# Altium project PGS-System.PrjPcb (part 8 of 16)

## Sheet RV1126_DRAM_SHEET.SchDoc
size A4; SheetNumber: 10; SheetTotal: 25
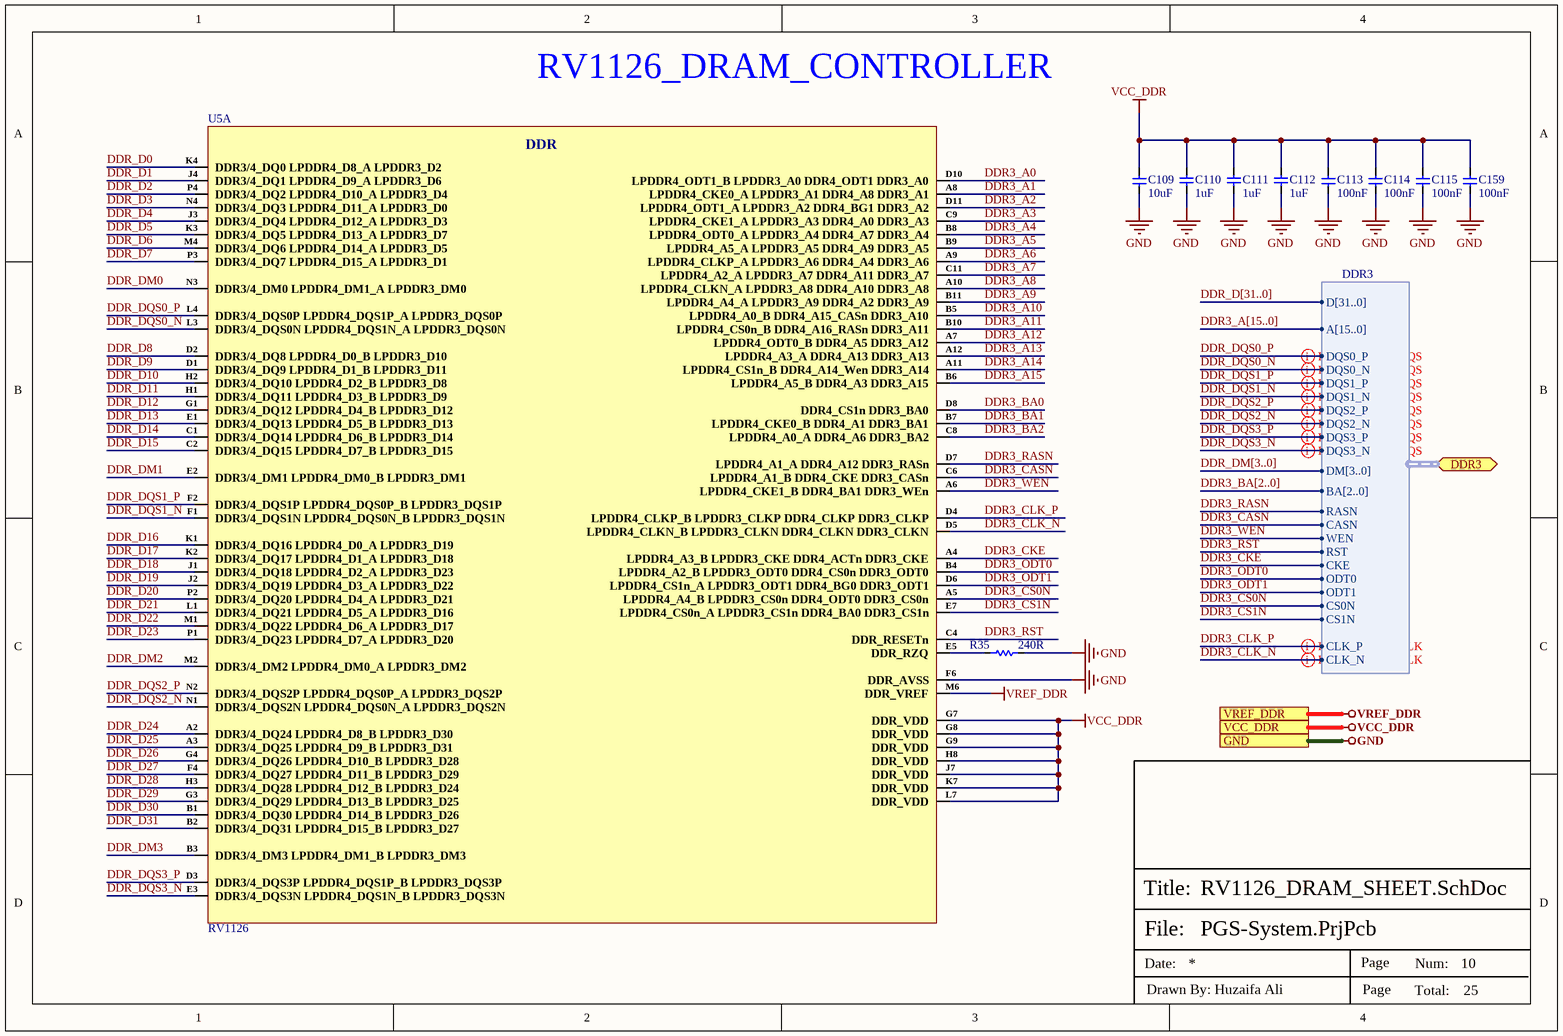
[diagram p10: RV1126_DRAM_SHEET.SchDoc]

### Parts
C109  10uF  [Cap-0603]
C110  1uF  [Cap-0402]
C111  1uF  [Cap-0402]
C112  1uF  [Cap-0402]
C113  100nF  [CAP-0201]
C114  100nF  [CAP-0201]
C115  100nF  [CAP-0201]
C159  100nF  [CAP-0201]
R35  240R  [Res-0201]
U5  RV1126  [FCCSP-409(14x14)]  (part A of 15)

### Ports
DDR3 (bidir, harness DDR3, see DDR3_SDRAM_INTERFACE[4C]), GND (see DDR3_SDRAM_INTERFACE[4D], DIGITAL_MEMS_MIC_INTERFACE[3D], eMMC_INTERFACE[3D], ETHERNET_SWITCH_INTERFACE[5C], IR-CUT_LIGHT SENSOR_SHEET[3D], MIPI TO HDMI_MODULE_INTERFACE[3D], MIPI-CSI_RXX_INTERFACE[4C], PoE PD INTERFACE[3D], PoE_PSE_CONTROLLER[5D], POWER_LDO_SHEET[3D], POWER_PMIC_RK809_CODEC[3D], POWER_PMIC_RK809_DC DC[3D], POWER_PMIC_RK809_LDO[4C], POWER_PMIC_RK809_MANAGEMENT[3D], RV1126_AUDIO_SHEET[3D], RV1126_eMMC_SPI-FLASH_SHEET[3D], RV1126_ETHERNET_SHEET[3D], RV1126_OSC-PLL-PMUIO[3C], RV1126_POWER_SHEET[1D], RV1126_SARADC_SHEET[3C], SPI_FLASH_INTERFACE[3D], SYNCHRONOUS _BUCK_CONTROLLER[3D], USB2.0_DEBUG_UART[3D], WIFI_AP6256_SHEET[4D]), VCC_DDR (see DDR3_SDRAM_INTERFACE[4D], POWER_PMIC_RK809_DC DC[3D]), VREF_DDR (see DDR3_SDRAM_INTERFACE[4D])

### Harnesses
DDR3: D[31..0], A[15..0], DQS0_N, DQS0_P, DQS1_N, DQS1_P, BA[2..0], CASN, RST, CKE, CS0N, CLK_P, CLK_N, DQS2_N, DQS2_P, DQS3_N, DQS3_P, CS1N, ODT0, ODT1, WEN, RASN, DM[3..0]

### Nets
GND: C109.1 C110.2 C111.2 C112.2 C113.1 C114.1 C115.1 C159.1 R35.2 U5.F6(DDR_AVSS) ; port GND  [project net KSENSD]
VCC_DDR: C109.2 C110.1 C111.1 C112.1 C113.2 C114.2 C115.2 C159.2 U5.G7(DDR_VDD) U5.G8(DDR_VDD) U5.G9(DDR_VDD) U5.H8(DDR_VDD) U5.J7(DDR_VDD) U5.K7(DDR_VDD) U5.L7(DDR_VDD) ; port VCC_DDR
VREF_DDR: U5.M6(DDR_VREF) ; port VREF_DDR
DDR3_A0: U5.D10(LPDDR4_ODT1_B_LPDDR3_A0_DDR4_ODT1_DDR3_A0)
DDR3_A1: U5.A8(LPDDR4_CKE0_A_LPDDR3_A1_DDR4_A8_DDR3_A1)
DDR3_A2: U5.D11(LPDDR4_ODT1_A_LPDDR3_A2_DDR4_BG1_DDR3_A2)
DDR3_A3: U5.C9(LPDDR4_CKE1_A_LPDDR3_A3_DDR4_A0_DDR3_A3)
DDR3_A4: U5.B8(LPDDR4_ODT0_A_LPDDR3_A4_DDR4_A7_DDR3_A4)
DDR3_A5: U5.B9(LPDDR4_A5_A_LPDDR3_A5_DDR4_A9_DDR3_A5)
DDR3_A6: U5.A9(LPDDR4_CLKP_A_LPDDR3_A6_DDR4_A4_DDR3_A6)
DDR3_A7: U5.C11(LPDDR4_A2_A_LPDDR3_A7_DDR4_A11_DDR3_A7)
DDR3_A8: U5.A10(LPDDR4_CLKN_A_LPDDR3_A8_DDR4_A10_DDR3_A8)
DDR3_A9: U5.B11(LPDDR4_A4_A_LPDDR3_A9_DDR4_A2_DDR3_A9)
DDR3_A10: U5.B5(LPDDR4_A0_B_DDR4_A15_CASn_DDR3_A10)
DDR3_A11: U5.B10(LPDDR4_CS0n_B_DDR4_A16_RASn_DDR3_A11)
DDR3_A12: U5.A7(LPDDR4_ODT0_B_DDR4_A5_DDR3_A12)
DDR3_A13: U5.A12(LPDDR4_A3_A_DDR4_A13_DDR3_A13)
DDR3_A14: U5.A11(LPDDR4_CS1n_B_DDR4_A14_Wen_DDR3_A14)
DDR3_A15: U5.B6(LPDDR4_A5_B_DDR4_A3_DDR3_A15)
DDR3_BA0: U5.D8(DDR4_CS1n_DDR3_BA0)
DDR3_BA1: U5.B7(LPDDR4_CKE0_B_DDR4_A1_DDR3_BA1)
DDR3_BA2: U5.C8(LPDDR4_A0_A_DDR4_A6_DDR3_BA2)
DDR3_CASN: U5.C6(LPDDR4_A1_B_DDR4_CKE_DDR3_CASn) ; port DDR3.CASN
DDR3_CKE: U5.A4(LPDDR4_A3_B_LPDDR3_CKE_DDR4_ACTn_DDR3_CKE) ; port DDR3.CKE
DDR3_CLK_N: U5.D5(LPDDR4_CLKN_B_LPDDR3_CLKN_DDR4_CLKN_DDR3_CLKN) ; port DDR3.CLK_N
DDR3_CLK_P: U5.D4(LPDDR4_CLKP_B_LPDDR3_CLKP_DDR4_CLKP_DDR3_CLKP) ; port DDR3.CLK_P
DDR3_CS0N: U5.A5(LPDDR4_A4_B_LPDDR3_CS0n_DDR4_ODT0_DDR3_CS0n) ; port DDR3.CS0N
DDR3_CS1N: U5.E7(LPDDR4_CS0n_A_LPDDR3_CS1n_DDR4_BA0_DDR3_CS1n) ; port DDR3.CS1N
DDR3_ODT0: U5.B4(LPDDR4_A2_B_LPDDR3_ODT0_DDR4_CS0n_DDR3_ODT0) ; port DDR3.ODT0
DDR3_ODT1: U5.D6(LPDDR4_CS1n_A_LPDDR3_ODT1_DDR4_BG0_DDR3_ODT1) ; port DDR3.ODT1
DDR3_RASN: U5.D7(LPDDR4_A1_A_DDR4_A12_DDR3_RASn) ; port DDR3.RASN
DDR3_RST: U5.C4(DDR_RESETn) ; port DDR3.RST
DDR3_WEN: U5.A6(LPDDR4_CKE1_B_DDR4_BA1_DDR3_WEn) ; port DDR3.WEN
DDR_D0: U5.K4(DDR3/4_DQ0_LPDDR4_D8_A_LPDDR3_D2)
DDR_D1: U5.J4(DDR3/4_DQ1_LPDDR4_D9_A_LPDDR3_D6)
DDR_D2: U5.P4(DDR3/4_DQ2_LPDDR4_D10_A_LPDDR3_D4)
DDR_D3: U5.N4(DDR3/4_DQ3_LPDDR4_D11_A_LPDDR3_D0)
DDR_D4: U5.J3(DDR3/4_DQ4_LPDDR4_D12_A_LPDDR3_D3)
DDR_D5: U5.K3(DDR3/4_DQ5_LPDDR4_D13_A_LPDDR3_D7)
DDR_D6: U5.M4(DDR3/4_DQ6_LPDDR4_D14_A_LPDDR3_D5)
DDR_D7: U5.P3(DDR3/4_DQ7_LPDDR4_D15_A_LPDDR3_D1)
DDR_D8: U5.D2(DDR3/4_DQ8_LPDDR4_D0_B_LPDDR3_D10)
DDR_D9: U5.D1(DDR3/4_DQ9_LPDDR4_D1_B_LPDDR3_D11)
DDR_D10: U5.H2(DDR3/4_DQ10_LPDDR4_D2_B_LPDDR3_D8)
DDR_D11: U5.H1(DDR3/4_DQ11_LPDDR4_D3_B_LPDDR3_D9)
DDR_D12: U5.G1(DDR3/4_DQ12_LPDDR4_D4_B_LPDDR3_D12)
DDR_D13: U5.E1(DDR3/4_DQ13_LPDDR4_D5_B_LPDDR3_D13)
DDR_D14: U5.C1(DDR3/4_DQ14_LPDDR4_D6_B_LPDDR3_D14)
DDR_D15: U5.C2(DDR3/4_DQ15_LPDDR4_D7_B_LPDDR3_D15)
DDR_D16: U5.K1(DDR3/4_DQ16_LPDDR4_D0_A_LPDDR3_D19)
DDR_D17: U5.K2(DDR3/4_DQ17_LPDDR4_D1_A_LPDDR3_D18)
DDR_D18: U5.J1(DDR3/4_DQ18_LPDDR4_D2_A_LPDDR3_D23)
DDR_D19: U5.J2(DDR3/4_DQ19_LPDDR4_D3_A_LPDDR3_D22)
DDR_D20: U5.P2(DDR3/4_DQ20_LPDDR4_D4_A_LPDDR3_D21)
DDR_D21: U5.L1(DDR3/4_DQ21_LPDDR4_D5_A_LPDDR3_D16)
DDR_D22: U5.M1(DDR3/4_DQ22_LPDDR4_D6_A_LPDDR3_D17)
DDR_D23: U5.P1(DDR3/4_DQ23_LPDDR4_D7_A_LPDDR3_D20)
DDR_D24: U5.A2(DDR3/4_DQ24_LPDDR4_D8_B_LPDDR3_D30)
DDR_D25: U5.A3(DDR3/4_DQ25_LPDDR4_D9_B_LPDDR3_D31)
DDR_D26: U5.G4(DDR3/4_DQ26_LPDDR4_D10_B_LPDDR3_D28)
DDR_D27: U5.F4(DDR3/4_DQ27_LPDDR4_D11_B_LPDDR3_D29)
DDR_D28: U5.H3(DDR3/4_DQ28_LPDDR4_D12_B_LPDDR3_D24)
DDR_D29: U5.G3(DDR3/4_DQ29_LPDDR4_D13_B_LPDDR3_D25)
DDR_D30: U5.B1(DDR3/4_DQ30_LPDDR4_D14_B_LPDDR3_D26)
DDR_D31: U5.B2(DDR3/4_DQ31_LPDDR4_D15_B_LPDDR3_D27)
DDR_DM0: U5.N3(DDR3/4_DM0_LPDDR4_DM1_A_LPDDR3_DM0)
DDR_DM1: U5.E2(DDR3/4_DM1_LPDDR4_DM0_B_LPDDR3_DM1)
DDR_DM2: U5.M2(DDR3/4_DM2_LPDDR4_DM0_A_LPDDR3_DM2)
DDR_DM3: U5.B3(DDR3/4_DM3_LPDDR4_DM1_B_LPDDR3_DM3)
DDR_DQS0_N: U5.L3(DDR3/4_DQS0N_LPDDR4_DQS1N_A_LPDDR3_DQS0N) ; port DDR3.DQS0_N
DDR_DQS0_P: U5.L4(DDR3/4_DQS0P_LPDDR4_DQS1P_A_LPDDR3_DQS0P) ; port DDR3.DQS0_P
DDR_DQS1_N: U5.F1(DDR3/4_DQS1N_LPDDR4_DQS0N_B_LPDDR3_DQS1N) ; port DDR3.DQS1_N
DDR_DQS1_P: U5.F2(DDR3/4_DQS1P_LPDDR4_DQS0P_B_LPDDR3_DQS1P) ; port DDR3.DQS1_P
DDR_DQS2_N: U5.N1(DDR3/4_DQS2N_LPDDR4_DQS0N_A_LPDDR3_DQS2N) ; port DDR3.DQS2_N
DDR_DQS2_P: U5.N2(DDR3/4_DQS2P_LPDDR4_DQS0P_A_LPDDR3_DQS2P) ; port DDR3.DQS2_P
DDR_DQS3_N: U5.E3(DDR3/4_DQS3N_LPDDR4_DQS1N_B_LPDDR3_DQS3N) ; port DDR3.DQS3_N
DDR_DQS3_P: U5.D3(DDR3/4_DQS3P_LPDDR4_DQS1P_B_LPDDR3_DQS3P) ; port DDR3.DQS3_P
NetR35_1: R35.1 U5.E5(DDR_RZQ)

### Buses and harness runs
bus DDR3_A[15..0]
bus DDR3_BA[2..0]
bus DDR_D[31..0]
bus DDR_DM[3..0]

### Layout directives
differential pair; differential pair class 100OHM_DDR_DQS: DDR_DQS0_N, DDR_DQS0_P, DDR_DQS1_N, DDR_DQS1_P, DDR_DQS2_N, DDR_DQS2_P, DDR_DQS3_N, DDR_DQS3_P
differential pair; differential pair class 100OHM_DDR_CLK: DDR3_CLK_N, DDR3_CLK_P

### Notes on the sheet
- RV1126_DRAM_CONTROLLER
- File:
- Title:
- Date:
- Page
- Num:
- Total:
- Drawn By: Huzaifa Ali
- (in symbol RV1126, part A) DDR

### Library data of the parts
C109 = CC0603KRX5R6BB106: as C38 on sheet POWER_PMIC_RK809_CODEC; Supplier 1: Digi-Key; Manufacturer Part Number: CC0603KRX5R6BB106; RoHS: Yes; Category: Ceramic Capacitors; Stock 1: 187515; Pricing 1: 1=0.24000, 10=0.16300, 50=0.09780, 100=0.08260, 500=0.05654, 1000=0.05001 (USD); Mount: Surface Mount; Case/Package: 0603; Case Code (Metric): 1608; Case Code (Imperial): 0603; Weight: 7.1E-05oz; Min Operating Temperature: -55°C; Max Operating Temperature: 85°C; Capacitance: 10uF; Packaging: Tape and Reel; Dielectric: X5R; Voltage Rating: 10V; Termination: SMD/SMT; Resistor Type: Ceramic; Voltage Rating (DC): 10V; Package Quantity: 4000; Length: 0.063inch; Width: 0.031inch; Thickness: 0.035inch; Depth: 0.8mm; Lead Free: Lead Free; Halogen Free: Halogen Free; RoHS Compliant: Yes; ComponentLink1URL: http://www.mouser.com/ds/2/447/Yageo_UPY-GP_NP0_16V-to-50V_9-358835.pdf?src-supplier=Mouser; ComponentLink1Description: http://www.mouser.com/ds/2/447/Yageo_UPY-GP_NP0_16V-to-50V_9-358835.pdf?src-supplier=Mouser; ComponentLink2URL: http://www.yageo.com/documents/recent/UPY-GPHC_X5R_4V-to-50V_25.pdf?src-supplier=Digi-Key; ComponentLink2Description: http://www.yageo.com/documents/recent/UPY-GPHC_X5R_4V-to-50V_25.pdf?src-supplier=Digi-Key; Supplier Part Number 1: 311-1782-1-ND; LCSC Part Number: C326057
C110-C112 = CC0402KRX5R6BB105: as C31 on sheet POWER_PMIC_RK809_MGM; Supplier 1: Mouser; Manufacturer Part Number: CC0402KRX5R6BB105; RoHS: Yes; Category: Ceramic Capacitors; Stock 1: 6711367; Pricing 1: 1=0.11000, 10=0.05500, 50=0.05500, 100=0.03300, 500=0.02700, 1000=0.02200, 2500=0.02100, 10000=0.01800 (USD); Mount: Surface Mount; Case/Package: 0402; Number of Pins: 2; Case Code (Metric): 1005; Case Code (Imperial): 0402; Min Operating Temperature: -55°C; Max Operating Temperature: 85°C; Capacitance: 1uF; Dielectric: X5R; Package Quantity: 1; Voltage Rating: 10V; Packaging: Tape and Reel; Voltage Rating (DC): 10V; Termination: SMD/SMT; Resistor Type: Ceramic; Series: CC; Construction: Flat; Length: 1mm; Width: 0.02inch; Height: 0.5mm; Thickness: 0.022inch; Depth: 0.5mm; Radiation Hardening: No; REACH SVHC: No SVHC; Lead Free: Lead Free; Halogen Free: Halogen Free; RoHS Compliant: Yes; ComponentLink1URL: https://datasheet.ciiva.com/176/upy-gphc-x5r-4v-to-50v-12-176704.pdf?src-supplier=Digi-Key; ComponentLink1Description: https://datasheet.ciiva.com/176/upy-gphc-x5r-4v-to-50v-12-176704.pdf?src-supplier=Digi-Key; ComponentLink2URL: https://datasheet.ciiva.com/176/mlccorderingcode-176705.pdf?src-supplier=Digi-Key; ComponentLink2Description: https://datasheet.ciiva.com/176/mlccorderingcode-176705.pdf?src-supplier=Digi-Key; ComponentLink3URL: https://datasheet.ciiva.com/176/mlccorderingcode-176706.pdf?src-supplier=Digi-Key; ComponentLink3Description: https://datasheet.ciiva.com/176/mlccorderingcode-176706.pdf?src-supplier=Digi-Key; Supplier Part Number 1: 603-CC402KRX5R6BB105; LCSC Part Number: C106254
C113-C115 C159 = CC0201KRX5R6BB104: as C88-C91 on sheet RV1126_POWER_SHEET; Supplier 1: Mouser; Manufacturer Part Number: CC0201KRX5R6BB104; RoHS: Yes; Category: Ceramic Capacitors; Stock 1: 824403; Pricing 1: 1=0.10000, 10=0.02400, 50=0.02400, 100=0.01900, 1000=0.01100, 10000=0.00900 (USD); Mount: Surface Mount; Case/Package: 0201; Case Code (Imperial): 0201; Case Code (Metric): 0603; Min Operating Temperature: -55°C; Max Operating Temperature: 85°C; Capacitance: 100nF; Dielectric: X5R; Packaging: Tape and Reel; Voltage Rating: 10V; Termination: SMD/SMT; Voltage Rating (DC): 10V; Series: CC; Length: 0.6mm; Width: 0.012inch; Height: 0.3mm; Depth: 0.3mm; Thickness: 0.013inch; Radiation Hardening: No; RoHS Compliant: Yes; Lead Free: Lead Free; Halogen Free: Halogen Free; ComponentLink1URL: https://datasheet.ciiva.com/11587/upy-gphc-x5r-4v-to-50v-12-11587190.pdf?src-supplier=Avnet; ComponentLink1Description: https://datasheet.ciiva.com/11587/upy-gphc-x5r-4v-to-50v-12-11587190.pdf?src-supplier=Avnet; Supplier Part Number 1: 603-CC201KRX5R6BB104; LCSC Part Number: C190183; Weight: 6E-06oz; Resistor Type: Ceramic; Construction: Flat
R35 = RC0201FR-07240RL: RES 240 OHM 1% 1/20W 0201; Manufacturer: Yageo; Power Rating: 50mW; Temperature Coefficient: 200ppm/°C; Item Type: Resistor; Supplier 1: Avnet; Manufacturer Part Number: RC0201FR-07240RL; RoHS: Yes; Category: Chip SMD Resistors; Stock 1: 90000; Pricing 1: 10000=0.00128 (USD); Mount: Surface Mount; Case/Package: 0201; Case Code (Metric): 0603; Case Code (Imperial): 0201; Min Operating Temperature: -55°C; Max Operating Temperature: 125°C; Resistance: 240R; Tolerance: 1%; Packaging: Tape and Reel; Resistor Type: Thick Film; Number of Terminations: 2; Max Power Dissipation: 50mW; Features: Moisture Resistant; Length: 0.024inch; Width: 0.012inch; Height: 0.01inch; Depth: 0.3mm; Military Standard: Not; Lead Free: Lead Free; RoHS Compliant: Yes; ComponentLink1URL: http://www.yageo.com/documents/recent/PYu-RC0201_51_RoHS_L_(8).pdf?src-supplier=Future+Electronics; ComponentLink1Description: http://www.yageo.com/documents/recent/PYu-RC0201_51_RoHS_L_(8).pdf?src-supplier=Future+Electronics; ComponentLink2URL: http://www.yageo.com/documents/recent/PYu-RC_Group_51_RoHS_L_10.pdf?src-supplier=Digi-Key; ComponentLink2Description: http://www.yageo.com/documents/recent/PYu-RC_Group_51_RoHS_L_10.pdf?src-supplier=Digi-Key; ComponentLink3URL: https://www.yageo.com/upload/media/product/productsearch/datasheet/rchip/PYu-RC_Group_51_RoHS_L_11.pdf?src-supplier=Digi-Key; ComponentLink3Description: https://www.yageo.com/upload/media/product/productsearch/datasheet/rchip/PYu-RC_Group_51_RoHS_L_11.pdf?src-supplier=Digi-Key; ComponentLink4URL: http://www.yageo.com/documents/recent/PYu-RC_Group_51_RoHS_L_9.pdf?src-supplier=Digi-Key; ComponentLink4Description: http://www.yageo.com/documents/recent/PYu-RC_Group_51_RoHS_L_9.pdf?src-supplier=Digi-Key; Supplier Part Number 1: RC0201FR-07240RL; LCSC Part Number: C155745
U5 = RV1126: as U5 on sheet RV1126_POWER_SHEET; Manufacturer Part Number: RV1126; Package: FCCSP-409(14x14); LCSC Part Number: C2859017; Item Type: Microcontroller; ComponentLink1Description: LCSC; ComponentLink1URL: https://www.lcsc.com/product-detail/Microcontroller-Units-MCUs-MPUs-SOCs_Rockchip-RV1126_C2859017.html

## Sheet RV1126_SARADC_SHEET.SchDoc
size A4; SheetNumber: 11; SheetTotal: 27
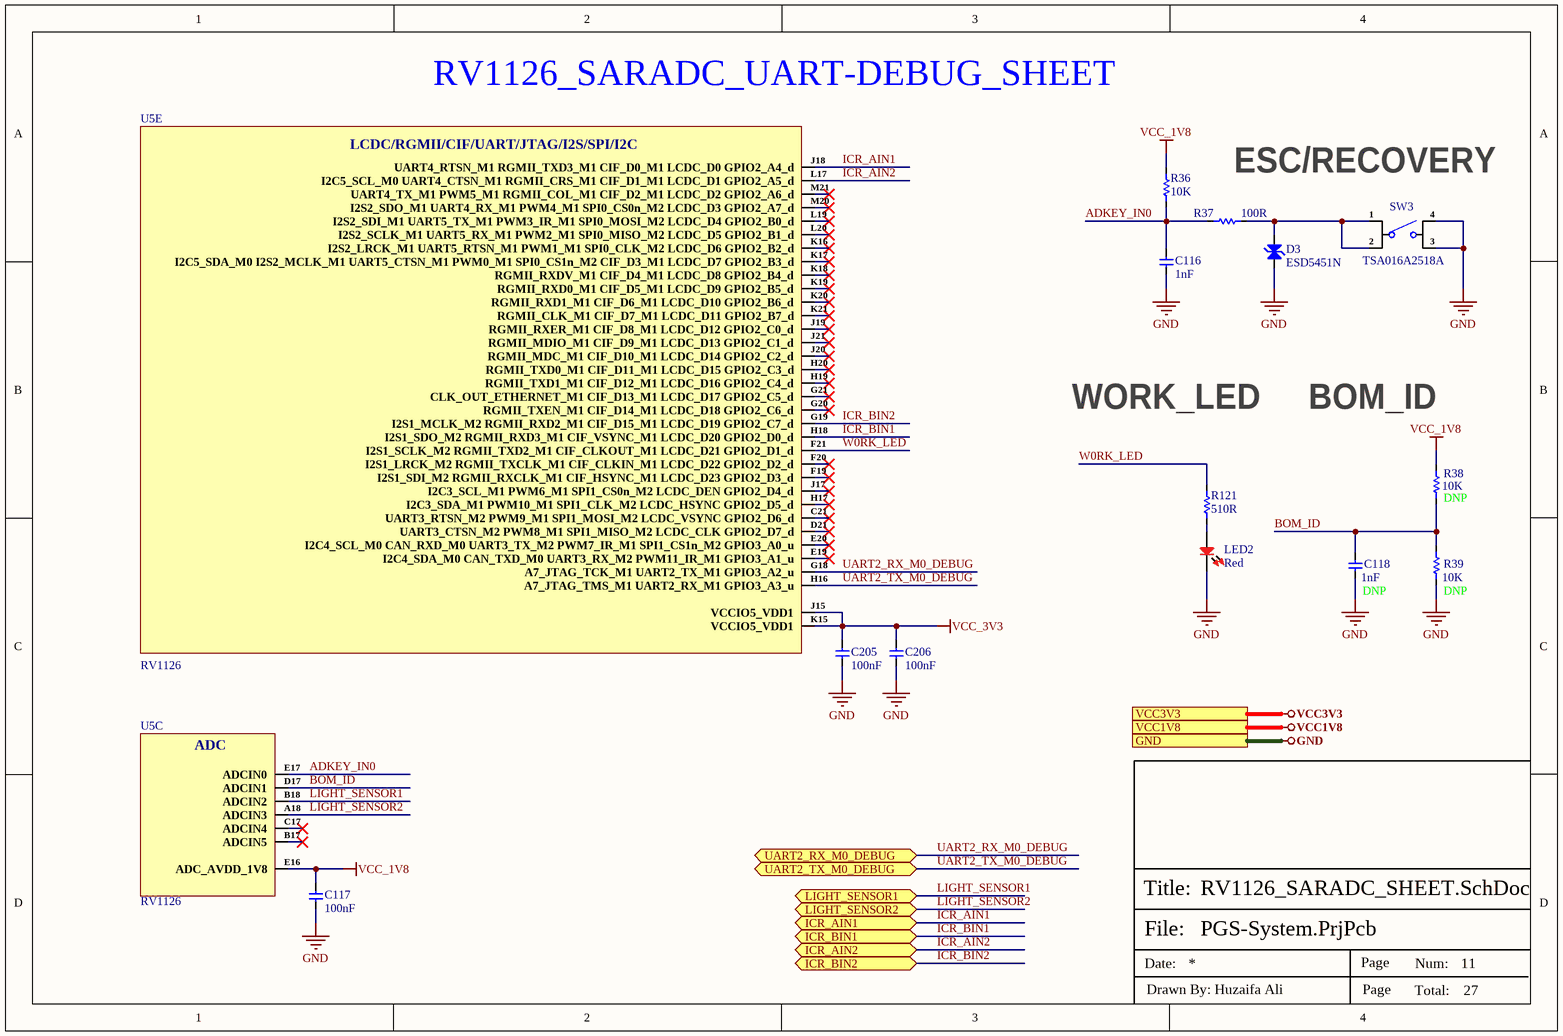
[diagram p11: RV1126_SARADC_SHEET.SchDoc]

### Parts
C116  1nF  [Cap-0402]
C117  100nF  [CAP-0201]
C118  DNP  [Cap-0402]
C205  100nF  [CAP-0201]
C206  100nF  [CAP-0201]
D3  ESD5451N  [DFN1006-2L (Bi-Directional)]
LED2  Red  [LED-0402]
R36  10K  [Res-0402]
R37  100R  [Res-0402]
R38  DNP  [Res-0402]
R39  DNP  [Res-0402]
R121  510R  [Res-0402]
SW3  TSA016A2518A  [TSA016A2518A]
U5  RV1126  [FCCSP-409(14x14)]  (parts C,E of 15)

### Ports
GND (see BUCK_CONTROLLER_SHEET[3D], DDR3_SDRAM_SHEET[5D], DEBUG_UART_INTERFACE[3D], DIGITAL_MEMS_INTERFACE[3C], eMMC_INTERFACE[3D], ETH_PoE-PD_INTERFACE[4D], ETH_SWITCH_INTERFACE[5D], IR-CUT_LIGHT SENSOR_SHEET[3D], MIPI TO HDMI_MODULE[3D], MIPI-CSI_RXX_INTERFACE[3C], PoE_PSE_CONTROLLER[5D], POWER_LDO_SHEET[3D], POWER_PMIC_RK809_CODEC[3C], POWER_PMIC_RK809_DC DC[3D], POWER_PMIC_RK809_LDO[4C], POWER_PMIC_RK809_MGM[3D], RV1126_AUDIO_SHEET[3D], RV1126_DRAM_SHEET[4C], RV1126_eMMC_SPI-FLASH[3C], RV1126_ETHERNET_SHEET[3D], RV1126_OSC-PLL-PMUIO[3C], RV1126_POWER_SHEET[1D], RV1126_SDMMC_SHEET[3C], SPI_FLASH_INTERFACE[3D], USB2.0_DEBUG_UART[3D], WIFI_AP6256_SHEET[3C]), ICR_AIN1 (bidir, see IR-CUT_LIGHT SENSOR_SHEET[2D]), ICR_AIN2 (bidir, see IR-CUT_LIGHT SENSOR_SHEET[2D]), ICR_BIN1 (bidir, see IR-CUT_LIGHT SENSOR_SHEET[2D]), ICR_BIN2 (bidir, see IR-CUT_LIGHT SENSOR_SHEET[2D]), LIGHT_SENSOR1 (bidir, see IR-CUT_LIGHT SENSOR_SHEET[2D]), LIGHT_SENSOR2 (bidir, see IR-CUT_LIGHT SENSOR_SHEET[2D]), UART2_RX_M0_DEBUG (bidir, see DEBUG_UART_INTERFACE[2D], RV1126_OSC-PLL-PMUIO[3D]), UART2_TX_M0_DEBUG (bidir, see DEBUG_UART_INTERFACE[2D], RV1126_OSC-PLL-PMUIO[3D]), VCC1V8 (see DIGITAL_MEMS_INTERFACE[3C], IR-CUT_LIGHT SENSOR_SHEET[3D], MIPI TO HDMI_MODULE[3D], MIPI-CSI_RXX_INTERFACE[3C], POWER_PMIC_RK809_LDO[4C], POWER_PMIC_RK809_MGM[3D], RV1126_AUDIO_SHEET[3D], RV1126_eMMC_SPI-FLASH[3C], RV1126_ETHERNET_SHEET[3D], RV1126_OSC-PLL-PMUIO[3C], RV1126_SDMMC_SHEET[3C], USB2.0_DEBUG_UART[3D], WIFI_AP6256_SHEET[3C]), VCC3V3 (see POWER_PMIC_RK809_LDO[4C], RV1126_ETHERNET_SHEET[3D], USB2.0_DEBUG_UART[3D], WIFI_AP6256_SHEET[3C])

### Nets
GND: C116.1 C117.1 C118.1 C205.1 C206.1 D3.1(K) LED2.2 R39.1 SW3.3 SW3.4 ; port GND  [project net KSENSD]
VCC_1V8: C117.2 R36.2 R38.2 U5.E16(ADC_AVDD_1V8)
VCC_3V3: C205.2 C206.2 U5.J15(VCCIO5_VDD1) U5.K15(VCCIO5_VDD1)
ADKEY_IN0: C116.2 R36.1 R37.1 U5.E17(ADCIN0)
BOM_ID: C118.2 R38.1 R39.2 U5.D17(ADCIN1)
ICR_AIN1: U5.J18(UART4_RTSN_M1_RGMII_TXD3_M1_CIF_D0_M1_LCDC_D0_GPIO2_A4_d) ; port ICR_AIN1
ICR_AIN2: U5.L17(I2C5_SCL_M0_UART4_CTSN_M1_RGMII_CRS_M1_CIF_D1_M1_LCDC_D1_GPIO2_A5_d) ; port ICR_AIN2
ICR_BIN1: U5.H18(I2S1_SDO_M2_RGMII_RXD3_M1_CIF_VSYNC_M1_LCDC_D20_GPIO2_D0_d) ; port ICR_BIN1
ICR_BIN2: U5.G19(I2S1_MCLK_M2_RGMII_RXD2_M1_CIF_D15_M1_LCDC_D19_GPIO2_C7_d) ; port ICR_BIN2
LIGHT_SENSOR1: U5.B18(ADCIN2) ; port LIGHT_SENSOR1
LIGHT_SENSOR2: U5.A18(ADCIN3) ; port LIGHT_SENSOR2
UART2_RX_M0_DEBUG: U5.G18(A7_JTAG_TCK_M1_UART2_TX_M1_GPIO3_A2_u) ; port UART2_RX_M0_DEBUG
UART2_TX_M0_DEBUG: U5.H16(A7_JTAG_TMS_M1_UART2_RX_M1_GPIO3_A3_u) ; port UART2_TX_M0_DEBUG
W0RK_LED: R121.1 U5.F21(I2S1_SCLK_M2_RGMII_TXD2_M1_CIF_CLKOUT_M1_LCDC_D21_GPIO2_D1_d)
NetD3_2: D3.2(K) R37.2 SW3.1 SW3.2
NetLED2_1: LED2.1 R121.2

Not connected (* = marked no-connect by the designer): U5 B17(ADCIN5)* C17(ADCIN4)* C21(UART3_RTSN_M2_PWM9_M1_SPI1_MOSI_M2_LCDC_VSYNC_GPIO2_D6_d)* D21(UART3_CTSN_M2_PWM8_M1_SPI1_MISO_M2_LCDC_CLK_GPIO2_D7_d)* E19(I2C4_SDA_M0_CAN_TXD_M0_UART3_RX_M2_PWM11_IR_M1_GPIO3_A1_u)* E20(I2C4_SCL_M0_CAN_RXD_M0_UART3_TX_M2_PWM7_IR_M1_SPI1_CS1n_M2_GPIO3_A0_u)* F19(I2S1_SDI_M2_RGMII_RXCLK_M1_CIF_HSYNC_M1_LCDC_D23_GPIO2_D3_d)* F20(I2S1_LRCK_M2_RGMII_TXCLK_M1_CIF_CLKIN_M1_LCDC_D22_GPIO2_D2_d)* G20(RGMII_TXEN_M1_CIF_D14_M1_LCDC_D18_GPIO2_C6_d)* G21(CLK_OUT_ETHERNET_M1_CIF_D13_M1_LCDC_D17_GPIO2_C5_d)* H17(I2C3_SDA_M1_PWM10_M1_SPI1_CLK_M2_LCDC_HSYNC_GPIO2_D5_d)* H19(RGMII_TXD1_M1_CIF_D12_M1_LCDC_D16_GPIO2_C4_d)* H20(RGMII_TXD0_M1_CIF_D11_M1_LCDC_D15_GPIO2_C3_d)* J17(I2C3_SCL_M1_PWM6_M1_SPI1_CS0n_M2_LCDC_DEN_GPIO2_D4_d)* J19(RGMII_RXER_M1_CIF_D8_M1_LCDC_D12_GPIO2_C0_d)* J20(RGMII_MDC_M1_CIF_D10_M1_LCDC_D14_GPIO2_C2_d)* J21(RGMII_MDIO_M1_CIF_D9_M1_LCDC_D13_GPIO2_C1_d)* K16(I2S2_LRCK_M1_UART5_RTSN_M1_PWM1_M1_SPI0_CLK_M2_LCDC_D6_GPIO2_B2_d)* K17(I2C5_SDA_M0_I2S2_MCLK_M1_UART5_CTSN_M1_PWM0_M1_SPI0_CS1n_M2_CIF_D3_M1_LCDC_D7_GPIO2_B3_d)* K18(RGMII_RXDV_M1_CIF_D4_M1_LCDC_D8_GPIO2_B4_d)* K19(RGMII_RXD0_M1_CIF_D5_M1_LCDC_D9_GPIO2_B5_d)* K20(RGMII_RXD1_M1_CIF_D6_M1_LCDC_D10_GPIO2_B6_d)* K21(RGMII_CLK_M1_CIF_D7_M1_LCDC_D11_GPIO2_B7_d)* L19(I2S2_SDI_M1_UART5_TX_M1_PWM3_IR_M1_SPI0_MOSI_M2_LCDC_D4_GPIO2_B0_d)* L20(I2S2_SCLK_M1_UART5_RX_M1_PWM2_M1_SPI0_MISO_M2_LCDC_D5_GPIO2_B1_d)* M20(I2S2_SDO_M1_UART4_RX_M1_PWM4_M1_SPI0_CS0n_M2_LCDC_D3_GPIO2_A7_d)* M21(UART4_TX_M1_PWM5_M1_RGMII_COL_M1_CIF_D2_M1_LCDC_D2_GPIO2_A6_d)*

### Notes on the sheet
- RV1126_SARADC_UART-DEBUG_SHEET
- ESC/RECOVERY
- WORK_LED
- BOM_ID
- (near R38) 10K
- (near C118) 1nF
- (near R39) 10K
- File:
- Title:
- Date:
- Page
- Num:
- Total:
- Drawn By: Huzaifa Ali
- (in symbol RV1126, part C) ADC
- (in symbol RV1126, part E) LCDC/RGMII/CIF/UART/JTAG/I2S/SPI/I2C

### Library data of the parts
C116 = GRM1555C1H102JA01D: CAP CER 1000PF 50V C0G/NP0 0402; Manufacturer: Murata; Material: Ceramic; Tolerance: 5%; Dielectric: C0G; Insulation Resistance: 10GR; Temperature Coefficient: 30ppm/°C; Item Type: Capacitor; Supplier 1: Avnet; Manufacturer Part Number: GRM1555C1H102JA01D; RoHS: Yes; Category: Ceramic Capacitors; Stock 1: 800000; Pricing 1: 10000=0.00648, 20000=0.00613, 40000=0.00578, 60000=0.00543, 80000=0.00508, 100000=0.00473, 1000000=0.00438 (USD); Mount: Surface Mount; Case/Package: 0402; Number of Pins: 2; Case Code (Metric): 1005; Case Code (Imperial): 0402; Dielectric Material: Ceramic; Min Operating Temperature: -55°C; Max Operating Temperature: 125°C; Package Quantity: 1; Capacitance: 1nF; Voltage Rating: 50V; Packaging: Tape and Reel; Voltage Rating (DC): 50V; Termination: SMD/SMT; Voltage: 50V; Series: GRM; Construction: Flat; Length: 1mm; Width: 0.5mm; Height: 0.5mm; Thickness: 0.022inch; Depth: 0.5mm; Size: 0.5mm; Radiation Hardening: No; Reach SVHC Compliant: Yes; Lead Free: Lead Free; RoHS Compliant: Yes; ComponentLink1URL: https://datasheet.ciiva.com/34302/1855908-34302849.pdf?src-supplier=Jameco; ComponentLink1Description: https://datasheet.ciiva.com/34302/1855908-34302849.pdf?src-supplier=Jameco; ComponentLink2URL: https://datasheet.ciiva.com/132/product-132800.pdf?src-supplier=Digi-Key; ComponentLink2Description: https://datasheet.ciiva.com/132/product-132800.pdf?src-supplier=Digi-Key; ComponentLink3URL: https://datasheet.ciiva.com/132/grm1555c1h102ja01-01-132799.pdf?src-supplier=Digi-Key; ComponentLink3Description: https://datasheet.ciiva.com/132/grm1555c1h102ja01-01-132799.pdf?src-supplier=Digi-Key; ComponentLink4URL: https://datasheet.ciiva.com/11786/0900766b807a1cab-11786727.pdf?src-supplier=RSComponents; ComponentLink4Description: https://datasheet.ciiva.com/11786/0900766b807a1cab-11786727.pdf?src-supplier=RSComponents; ComponentLink5URL: https://datasheet.ciiva.com/29200/453569-da-01-en-vs-kondensator-0402-29200121.pdf?src-supplier=Conrad; ComponentLink5Description: https://datasheet.ciiva.com/29200/453569-da-01-en-vs-kondensator-0402-29200121.pdf?src-supplier=Conrad; ComponentLink6URL: https://datasheet.ciiva.com/7828/4360-7828821.pdf?src-supplier=Element14; ComponentLink6Description: https://datasheet.ciiva.com/7828/4360-7828821.pdf?src-supplier=Element14; ComponentLink7URL: https://datasheet.ciiva.com/14116/grmseries-tc-hitype-eng-14116919.pdf?src-supplier=Distrelec; ComponentLink7Description: https://datasheet.ciiva.com/14116/grmseries-tc-hitype-eng-14116919.pdf?src-supplier=Distrelec; ComponentLink8URL: https://datasheet.ciiva.com/14116/grmseries-tc-hitype-eng-14116858.pdf?src-supplier=Distrelec; ComponentLink8Description: https://datasheet.ciiva.com/14116/grmseries-tc-hitype-eng-14116858.pdf?src-supplier=Distrelec; ComponentLink9URL: https://datasheet.ciiva.com/132/grm1555c1h102ja01-01-132801.pdf?src-supplier=Digi-Key; ComponentLink9Description: https://datasheet.ciiva.com/132/grm1555c1h102ja01-01-132801.pdf?src-supplier=Digi-Key; ComponentLink10URL: https://datasheet.ciiva.com/7828/1747436-7828822.pdf?src-supplier=Element14; ComponentLink10Description: https://datasheet.ciiva.com/7828/1747436-7828822.pdf?src-supplier=Element14; Supplier Part Number 1: GRM1555C1H102JA01D; LCSC Part Number: C76947
C117 C205 C206 = CC0201KRX5R6BB104: as C88-C91 on sheet RV1126_POWER_SHEET; Supplier 1: Mouser; Manufacturer Part Number: CC0201KRX5R6BB104; RoHS: Yes; Category: Ceramic Capacitors; Stock 1: 824403; Pricing 1: 1=0.10000, 10=0.02400, 50=0.02400, 100=0.01900, 1000=0.01100, 10000=0.00900 (USD); Mount: Surface Mount; Case/Package: 0201; Case Code (Imperial): 0201; Case Code (Metric): 0603; Weight: 6E-06oz; Min Operating Temperature: -55°C; Max Operating Temperature: 85°C; Capacitance: 100nF; Dielectric: X5R; Voltage Rating (DC): 10V; Packaging: Tape and Reel; Termination: SMD/SMT; Resistor Type: Ceramic; Voltage Rating: 10V; Series: CC; Construction: Flat; Length: 0.6mm; Width: 0.012inch; Height: 0.3mm; Thickness: 0.013inch; Depth: 0.3mm; Radiation Hardening: No; Lead Free: Lead Free; Halogen Free: Halogen Free; RoHS Compliant: Yes; ComponentLink1URL: https://datasheet.ciiva.com/11587/upy-gphc-x5r-4v-to-50v-12-11587190.pdf?src-supplier=Avnet; ComponentLink1Description: https://datasheet.ciiva.com/11587/upy-gphc-x5r-4v-to-50v-12-11587190.pdf?src-supplier=Avnet; Supplier Part Number 1: 603-CC201KRX5R6BB104; LCSC Part Number: C190183
C118 = GRM1555C1H102JA01D: CAP CER 1000PF 50V C0G/NP0 0402; Manufacturer: Murata; Material: Ceramic; Capacitance: 1nF; Tolerance: 5%; Dielectric: C0G; Insulation Resistance: 10GR; Temperature Coefficient: 30ppm/°C; Item Type: Capacitor; Supplier 1: Avnet; Manufacturer Part Number: GRM1555C1H102JA01D; RoHS: Yes; Category: Ceramic Capacitors; Stock 1: 800000; Pricing 1: 10000=0.00648, 20000=0.00613, 40000=0.00578, 60000=0.00543, 80000=0.00508, 100000=0.00473, 1000000=0.00438 (USD); Mount: Surface Mount; Case/Package: 0402; Number of Pins: 2; Case Code (Metric): 1005; Case Code (Imperial): 0402; Dielectric Material: Ceramic; Min Operating Temperature: -55°C; Max Operating Temperature: 125°C; Package Quantity: 1; Voltage Rating: 50V; Packaging: Tape and Reel; Voltage Rating (DC): 50V; Termination: SMD/SMT; Voltage: 50V; Series: GRM; Construction: Flat; Length: 1mm; Width: 0.5mm; Height: 0.5mm; Thickness: 0.022inch; Depth: 0.5mm; Size: 0.5mm; Radiation Hardening: No; Reach SVHC Compliant: Yes; Lead Free: Lead Free; RoHS Compliant: Yes; ComponentLink1URL: https://datasheet.ciiva.com/34302/1855908-34302849.pdf?src-supplier=Jameco; ComponentLink1Description: https://datasheet.ciiva.com/34302/1855908-34302849.pdf?src-supplier=Jameco; ComponentLink2URL: https://datasheet.ciiva.com/132/product-132800.pdf?src-supplier=Digi-Key; ComponentLink2Description: https://datasheet.ciiva.com/132/product-132800.pdf?src-supplier=Digi-Key; ComponentLink3URL: https://datasheet.ciiva.com/132/grm1555c1h102ja01-01-132799.pdf?src-supplier=Digi-Key; ComponentLink3Description: https://datasheet.ciiva.com/132/grm1555c1h102ja01-01-132799.pdf?src-supplier=Digi-Key; ComponentLink4URL: https://datasheet.ciiva.com/11786/0900766b807a1cab-11786727.pdf?src-supplier=RSComponents; ComponentLink4Description: https://datasheet.ciiva.com/11786/0900766b807a1cab-11786727.pdf?src-supplier=RSComponents; ComponentLink5URL: https://datasheet.ciiva.com/29200/453569-da-01-en-vs-kondensator-0402-29200121.pdf?src-supplier=Conrad; ComponentLink5Description: https://datasheet.ciiva.com/29200/453569-da-01-en-vs-kondensator-0402-29200121.pdf?src-supplier=Conrad; ComponentLink6URL: https://datasheet.ciiva.com/7828/4360-7828821.pdf?src-supplier=Element14; ComponentLink6Description: https://datasheet.ciiva.com/7828/4360-7828821.pdf?src-supplier=Element14; ComponentLink7URL: https://datasheet.ciiva.com/14116/grmseries-tc-hitype-eng-14116919.pdf?src-supplier=Distrelec; ComponentLink7Description: https://datasheet.ciiva.com/14116/grmseries-tc-hitype-eng-14116919.pdf?src-supplier=Distrelec; ComponentLink8URL: https://datasheet.ciiva.com/14116/grmseries-tc-hitype-eng-14116858.pdf?src-supplier=Distrelec; ComponentLink8Description: https://datasheet.ciiva.com/14116/grmseries-tc-hitype-eng-14116858.pdf?src-supplier=Distrelec; ComponentLink9URL: https://datasheet.ciiva.com/132/grm1555c1h102ja01-01-132801.pdf?src-supplier=Digi-Key; ComponentLink9Description: https://datasheet.ciiva.com/132/grm1555c1h102ja01-01-132801.pdf?src-supplier=Digi-Key; ComponentLink10URL: https://datasheet.ciiva.com/7828/1747436-7828822.pdf?src-supplier=Element14; ComponentLink10Description: https://datasheet.ciiva.com/7828/1747436-7828822.pdf?src-supplier=Element14; Supplier Part Number 1: GRM1555C1H102JA01D; LCSC Part Number: C76947
D3 = ESD5451N: as D1 on sheet POWER_PMIC_RK809_MGM; Manufacturer Part Number: ESD5451N; Footprint: DFN1006-2(0402); ComponentLink1Description: LCSC; ComponentLink1URL: https://www.lcsc.com/product-detail/span-style-background-color-ff0-ESD-span-Protection-Devices_TECH-PUBLIC-ESD5451N_C2936977.html; LCSC Part Number: C2936977
LED2 = XZMDK68W-2: LED RED CLEAR CHIP SMD; Manufacturer: SunLED; Lens Color: Colorless; Luminous Intensity: 69mcd; Test Current: 20mA; Viewing Angle: 120°; Dominant Wavelength: 630nm; Forward Voltage: 1.95V; Supplier 1: Digi-Key; Manufacturer Part Number: XZMDK68W-2; Stock 1: 69539; Pricing 1: 1=0.43, 10=0.306, 100=0.136, 500=0.0952, 1000=0.0782 (USD); Mount: Surface Mount; Case/Package: 0402; Color: Red; Case Code (Metric): 1005; Case Code (Imperial): 0402; Packaging: Tape and Reel; Lens Transparency: Clear; Length: 1mm; Height: 0.6mm; Width: 0.5mm; ComponentLink1URL: http://www.sunledusa.com/products/spec/XZMDK68W-2.pdf?src-supplier=Digi-Key; ComponentLink1Description: http://www.sunledusa.com/products/spec/XZMDK68W-2.pdf?src-supplier=Digi-Key; ComponentLink2URL: https://www.sunledusa.com/products/spec/XZMDK68W-2.pdf?src-supplier=Digi-Key; ComponentLink2Description: https://www.sunledusa.com/products/spec/XZMDK68W-2.pdf?src-supplier=Digi-Key; Supplier Part Number 1: 1497-1174-6-ND; Item Type: LED
R36 R38 R39 = RC0402FR-0710KL: as R9 on sheet POWER_PMIC_RK809_MGM; Supplier 1: Mouser; Manufacturer Part Number: RC0402FR-0710KL; RoHS: Yes; Category: Chip SMD Resistors; Stock 1: 18648329; Pricing 1: 1=0.10000, 10=0.01400, 50=0.01400, 100=0.00500, 1000=0.00300, 10000=0.00200 (USD); Case/Package: 0402; Number of Pins: 2; Case Code (Imperial): 0402; Case Code (Metric): 1005; Min Operating Temperature: -55°C; Max Operating Temperature: 155°C; Resistor Type: Thick Film; Tolerance: 1%; Packaging: Tape and Reel; Voltage Rating: 50V; Termination: SMD/SMT; Working Voltage: 50V; Number of Terminations: 2; Features: Moisture Resistant; Series: RC; Resistance Tolerance: 1%; Construction: Rectangular; Length: 1mm; Width: 0.5mm; Height: 0.32mm; Depth: 0.5mm; Lead Pitch: 0.2mm; REACH SVHC: No SVHC; Lead Free: Lead Free; RoHS Compliant: Yes; Military Standard: Not; ComponentLink1URL: https://datasheet.ciiva.com/7660/38568-7660787.pdf?src-supplier=Element14; ComponentLink1Description: https://datasheet.ciiva.com/7660/38568-7660787.pdf?src-supplier=Element14; ComponentLink2URL: https://datasheet.ciiva.com/7849/1686128-7849814.pdf?src-supplier=Element14; ComponentLink2Description: https://datasheet.ciiva.com/7849/1686128-7849814.pdf?src-supplier=Element14; ComponentLink3URL: https://datasheet.ciiva.com/7983/1018594-7983486.pdf?src-supplier=Element14; ComponentLink3Description: https://datasheet.ciiva.com/7983/1018594-7983486.pdf?src-supplier=Element14; ComponentLink4URL: https://datasheet.ciiva.com/22747/1018594-22747512.pdf?src-supplier=Element14; ComponentLink4Description: https://datasheet.ciiva.com/22747/1018594-22747512.pdf?src-supplier=Element14; ComponentLink5URL: https://datasheet.ciiva.com/12667/pyu-rc0402-51-rohs-l-6-r-12667067.pdf?src-supplier=Mouser; ComponentLink5Description: https://datasheet.ciiva.com/12667/pyu-rc0402-51-rohs-l-6-r-12667067.pdf?src-supplier=Mouser; ComponentLink6URL: https://datasheet.ciiva.com/7849/1784430-7849813.pdf?src-supplier=Element14; ComponentLink6Description: https://datasheet.ciiva.com/7849/1784430-7849813.pdf?src-supplier=Element14; ComponentLink7URL: https://datasheet.ciiva.com/7849/1784430-7849815.pdf?src-supplier=Element14; ComponentLink7Description: https://datasheet.ciiva.com/7849/1784430-7849815.pdf?src-supplier=Element14; Supplier Part Number 1: 603-RC0402FR-0710KL; LCSC Part Number: C60490
R37 = RC0402FR-07100RL: RES 100 OHM 1% 1/16W 0402; Manufacturer: Yageo; Power Rating: 62.5mW; Voltage Rating: 50V; Temperature Coefficient: 100ppm/°C; Max Power Dissipation: 63mW; Item Type: Resistor; Supplier 1: Mouser; Manufacturer Part Number: RC0402FR-07100RL; RoHS: Yes; Category: Chip SMD Resistors; Stock 1: 699545; Pricing 1: 1=0.10000, 10=0.01200, 50=0.01200, 100=0.00500, 1000=0.00300, 2500=0.00200, 10000=0.00100 (USD); Case/Package: 0402; Number of Pins: 2; Case Code (Imperial): 0402; Case Code (Metric): 1005; Size Code: 0402; Min Operating Temperature: -55°C; Max Operating Temperature: 155°C; Tolerance: 1%; Voltage Rating (DC): 50V; Resistance: 100R; Packaging: Tape and Reel; Termination: SMD/SMT; Resistor Type: Thick Film; Features: Moisture Resistant; Series: RC; Number of Terminations: 2; Resistance Tolerance: 1%; Construction: Rectangular; Technology: THICK FILM; Length: 1mm; Width: 0.5mm; Height: 0.32mm; Depth: 0.5mm; RoHS Compliant: Yes; REACH SVHC: No SVHC; Military Standard: Not; Lead Free: Lead Free; ComponentLink1URL: https://datasheet.ciiva.com/11808/0900766b80c66297-11808765.pdf?src-supplier=RSComponents; ComponentLink1Description: https://datasheet.ciiva.com/11808/0900766b80c66297-11808765.pdf?src-supplier=RSComponents; ComponentLink2URL: https://datasheet.ciiva.com/7849/1784430-7849810.pdf?src-supplier=Element14; ComponentLink2Description: https://datasheet.ciiva.com/7849/1784430-7849810.pdf?src-supplier=Element14; ComponentLink3URL: https://datasheet.ciiva.com/28367/1018594-28367226.pdf?src-supplier=Element14; ComponentLink3Description: https://datasheet.ciiva.com/28367/1018594-28367226.pdf?src-supplier=Element14; ComponentLink4URL: https://datasheet.ciiva.com/22747/1018594-22747511.pdf?src-supplier=Element14; ComponentLink4Description: https://datasheet.ciiva.com/22747/1018594-22747511.pdf?src-supplier=Element14; ComponentLink5URL: https://datasheet.ciiva.com/12667/pyu-rc0402-51-rohs-l-6-r-12667957.pdf?src-supplier=Mouser; ComponentLink5Description: https://datasheet.ciiva.com/12667/pyu-rc0402-51-rohs-l-6-r-12667957.pdf?src-supplier=Mouser; ComponentLink6URL: https://datasheet.ciiva.com/15189/getdatasheetpartid-329466-15189335.pdf?src-supplier=Verical; ComponentLink6Description: https://datasheet.ciiva.com/15189/getdatasheetpartid-329466-15189335.pdf?src-supplier=Verical; ComponentLink7URL: https://datasheet.ciiva.com/16740/pyu-rc0402-51-rohs-l-6-r-16740566.pdf?src-supplier=Future+Electronics; ComponentLink7Description: https://datasheet.ciiva.com/16740/pyu-rc0402-51-rohs-l-6-r-16740566.pdf?src-supplier=Future+Electronics; Supplier Part Number 1: 603-RC0402FR-07100RL; LCSC Part Number: C106232
R121 = RT0402FRE07510RL: RES SMD 510 OHM 1% 1/16W 0402; Manufacturer: Yageo; Max Power Dissipation: 63mW; Temperature Coefficient: 50ppm/°C; Voltage Rating (DC): 50V; Item Type: Resistor; Supplier: Digikey; Supplier Part Number: 13-RT0402FRE07510RLCT-ND; Manufacturer Part Number: RT0402FRE07510RL; RoHS: Yes; Category: Chip SMD Resistors; Stock: 19529; Pricing: 1=0.1, 10=0.027, 50=0.0224, 100=0.0203, 500=0.0161, 1000=0.01443, 5000=0.01101 (USD); Case/Package: 0402; Min Operating Temperature: -55°C; Max Operating Temperature: 125°C; Package Quantity: 10000; Packaging: Tape and Reel; Value: 510R; Tolerance: 1%; Number of Terminations: 2; Series: RT; Length: 0.039inch; Width: 0.02inch; Height: 0.014inch; Lead Free: Lead Free; RoHS Compliant: Yes; ComponentLink1URL: https://datasheet.ciiva.com/2561/pyu-rt-1-to-0-05-rohs-l-5-2561767.pdf?src-supplier=Digikey; ComponentLink1Description: https://datasheet.ciiva.com/2561/pyu-rt-1-to-0-05-rohs-l-5-2561767.pdf?src-supplier=Digikey; LCSC Part Number: C854355
SW3 = TSA016A2518A: 3.35mm 2.5mm Oval button 50mA Brick nogging 4.2mm 180gf 12V SMD Tactile Switches ROHS; Manufacturer: BZCN; Manufacturer Part Number: TSA016A2518A; Package: SMD; LCSC Part Number: C2888427; Item Type: Tactile Switch; ComponentLink1Description: LCSC; ComponentLink1URL: https://jlcpcb.com/partdetail/Bzcn-TSA016A2518A/C2888427
U5 = RV1126: as U5 on sheet RV1126_POWER_SHEET; Manufacturer Part Number: RV1126; Package: FCCSP-409(14x14); LCSC Part Number: C2859017; Item Type: Microcontroller; ComponentLink1Description: LCSC; ComponentLink1URL: https://www.lcsc.com/product-detail/Microcontroller-Units-MCUs-MPUs-SOCs_Rockchip-RV1126_C2859017.html

## Sheet RV1126_AUDIO_SHEET.SchDoc
size A4; SheetNumber: 13; SheetTotal: 28
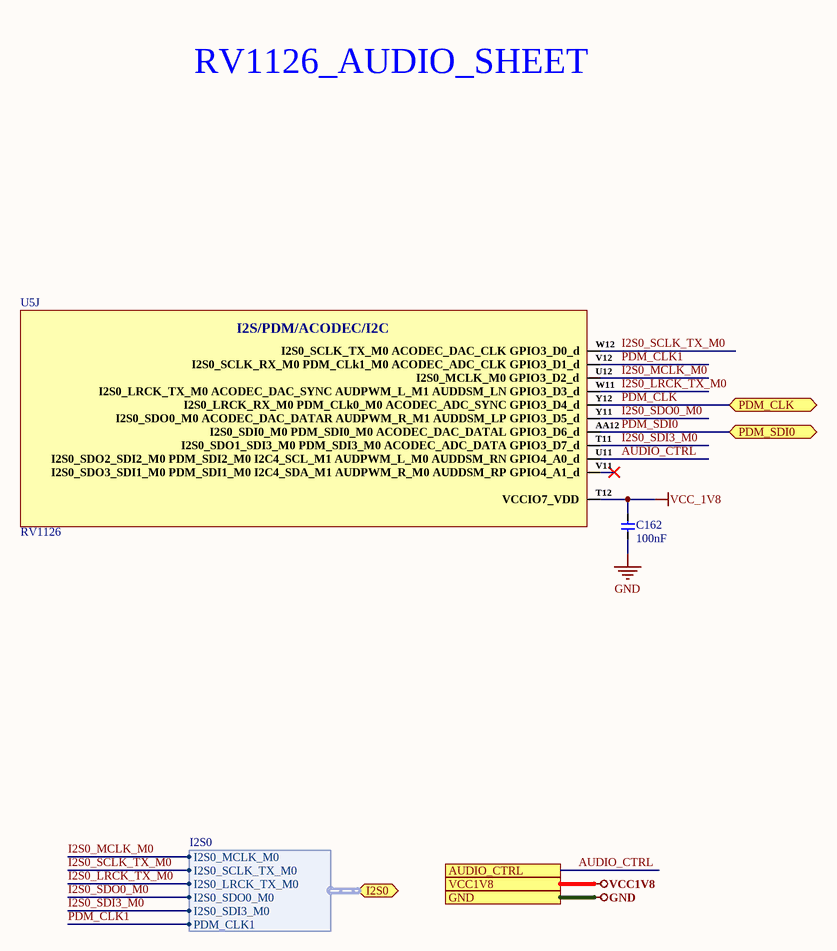
[diagram p12: RV1126_AUDIO_SHEET.SchDoc]

### Parts
C162  100nF  [CAP-0201]
U5  RV1126  [FCCSP-409(14x14)]  (part J of 15)

### Ports
AUDIO_CTRL (see SPEARKER_INTERFACE_SHEET[3C]), GND (see BUCK_CONTROLLER_SHEET2[3D], BUCK_CONVERTER_SHEET1[3D], DDR3_SDRAM_SHEET[5D], DEBUG_UART_INTERFACE[3D], DIGITAL_MEMS_INTERFACE[3C], eMMC_INTERFACE[3D], ETH_PoE-PD_INTERFACE[4D], ETH_SWITCH_INTERFACE[5D], IR-CUT_LIGHT SENSOR_SHEET[3D], MIPI TO HDMI_MODULE[3D], MIPI-CSI_RXX_INTERFACE[3C], PoE_PSE_CONTROLLER[5D], POWER_LDO_SHEET[3D], POWER_PMIC_RK809_CODEC[3C], POWER_PMIC_RK809_DC DC[3D], POWER_PMIC_RK809_LDO[4C], POWER_PMIC_RK809_MGM[3D], RV1126_DRAM_SHEET[4C], RV1126_eMMC_SPI-FLASH[3C], RV1126_ETHERNET_SHEET[3D], RV1126_OSC-PLL-PMUIO[3C], RV1126_POWER_SHEET[1D], RV1126_SARADC_SHEET[3C], RV1126_SDMMC_SHEET[3C], SPEARKER_INTERFACE_SHEET[3C], SPI_FLASH_INTERFACE[3D], USB2.0_DEBUG_UART[3D]), I2S0 (bidir, harness I2S0, see POWER_PMIC_RK809_CODEC[3C]), PDM_CLK (bidir, see DIGITAL_MEMS_INTERFACE[3C]), PDM_SDI0 (bidir, see DIGITAL_MEMS_INTERFACE[3C]), VCC1V8 (see DIGITAL_MEMS_INTERFACE[3C], IR-CUT_LIGHT SENSOR_SHEET[3D], MIPI TO HDMI_MODULE[3D], MIPI-CSI_RXX_INTERFACE[3C], POWER_PMIC_RK809_LDO[4C], POWER_PMIC_RK809_MGM[3D], RV1126_eMMC_SPI-FLASH[3C], RV1126_ETHERNET_SHEET[3D], RV1126_OSC-PLL-PMUIO[3C], RV1126_SARADC_SHEET[3C], RV1126_SDMMC_SHEET[3C], USB2.0_DEBUG_UART[3D])

### Harnesses
I2S0: I2S0_MCLK_M0, I2S0_SCLK_TX_M0, I2S0_LRCK_TX_M0, I2S0_SDO0_M0, I2S0_SDI3_M0, PDM_CLK1

### Nets
GND: C162.1 ; port GND  [project net KSENSD]
VCC_1V8: C162.2 U5.T12(VCCIO7_VDD)
AUDIO_CTRL: U5.U11(I2S0_SDO2_SDI2_M0_PDM_SDI2_M0_I2C4_SCL_M1_AUDPWM_L_M0_AUDDSM_RN_GPIO4_A0_d) ; port AUDIO_CTRL
I2S0_LRCK_TX_M0: U5.W11(I2S0_LRCK_TX_M0_ACODEC_DAC_SYNC_AUDPWM_L_M1_AUDDSM_LN_GPIO3_D3_d) ; port I2S0.I2S0_LRCK_TX_M0
I2S0_MCLK_M0: U5.U12(I2S0_MCLK_M0_GPIO3_D2_d) ; port I2S0.I2S0_MCLK_M0
I2S0_SCLK_TX_M0: U5.W12(I2S0_SCLK_TX_M0_ACODEC_DAC_CLK_GPIO3_D0_d) ; port I2S0.I2S0_SCLK_TX_M0
I2S0_SDI3_M0: U5.T11(I2S0_SDO1_SDI3_M0_PDM_SDI3_M0_ACODEC_ADC_DATA_GPIO3_D7_d) ; port I2S0.I2S0_SDI3_M0
I2S0_SDO0_M0: U5.Y11(I2S0_SDO0_M0_ACODEC_DAC_DATAR_AUDPWM_R_M1_AUDDSM_LP_GPIO3_D5_d) ; port I2S0.I2S0_SDO0_M0
PDM_CLK: U5.Y12(I2S0_LRCK_RX_M0_PDM_CLk0_M0_ACODEC_ADC_SYNC_GPIO3_D4_d) ; port PDM_CLK
PDM_CLK1: U5.V12(I2S0_SCLK_RX_M0_PDM_CLk1_M0_ACODEC_ADC_CLK_GPIO3_D1_d) ; port I2S0.PDM_CLK1
PDM_SDI0: U5.AA12(I2S0_SDI0_M0_PDM_SDI0_M0_ACODEC_DAC_DATAL_GPIO3_D6_d) ; port PDM_SDI0

Not connected (* = marked no-connect by the designer): U5 V11(I2S0_SDO3_SDI1_M0_PDM_SDI1_M0_I2C4_SDA_M1_AUDPWM_R_M0_AUDDSM_RP_GPIO4_A1_d)*

### Notes on the sheet
- RV1126_AUDIO_SHEET
- File:
- Title:
- Date:
- Page
- Num:
- Total:
- Drawn By: Huzaifa Ali
- (in symbol RV1126, part J) I2S/PDM/ACODEC/I2C

### Library data of the parts
C162 = CC0201KRX5R6BB104: as C88-C91 on sheet RV1126_POWER_SHEET; Supplier 1: Mouser; Manufacturer Part Number: CC0201KRX5R6BB104; RoHS: Yes; Category: Ceramic Capacitors; Stock 1: 824403; Pricing 1: 1=0.10000, 10=0.02400, 50=0.02400, 100=0.01900, 1000=0.01100, 10000=0.00900 (USD); Mount: Surface Mount; Case/Package: 0201; Case Code (Imperial): 0201; Case Code (Metric): 0603; Weight: 6E-06oz; Min Operating Temperature: -55°C; Max Operating Temperature: 85°C; Capacitance: 100nF; Dielectric: X5R; Voltage Rating (DC): 10V; Packaging: Tape and Reel; Termination: SMD/SMT; Resistor Type: Ceramic; Voltage Rating: 10V; Series: CC; Construction: Flat; Length: 0.6mm; Width: 0.012inch; Height: 0.3mm; Thickness: 0.013inch; Depth: 0.3mm; Radiation Hardening: No; Lead Free: Lead Free; Halogen Free: Halogen Free; RoHS Compliant: Yes; ComponentLink1URL: https://datasheet.ciiva.com/11587/upy-gphc-x5r-4v-to-50v-12-11587190.pdf?src-supplier=Avnet; ComponentLink1Description: https://datasheet.ciiva.com/11587/upy-gphc-x5r-4v-to-50v-12-11587190.pdf?src-supplier=Avnet; Supplier Part Number 1: 603-CC201KRX5R6BB104; LCSC Part Number: C190183
U5 = RV1126: as U5 on sheet RV1126_POWER_SHEET; Manufacturer Part Number: RV1126; Package: FCCSP-409(14x14); LCSC Part Number: C2859017; Item Type: Microcontroller; ComponentLink1Description: LCSC; ComponentLink1URL: https://www.lcsc.com/product-detail/Microcontroller-Units-MCUs-MPUs-SOCs_Rockchip-RV1126_C2859017.html